# Altium schematic sheet Charging Section.SchDoc
size A; DocumentNumber: 5; SheetNumber: 5; SheetTotal: 8
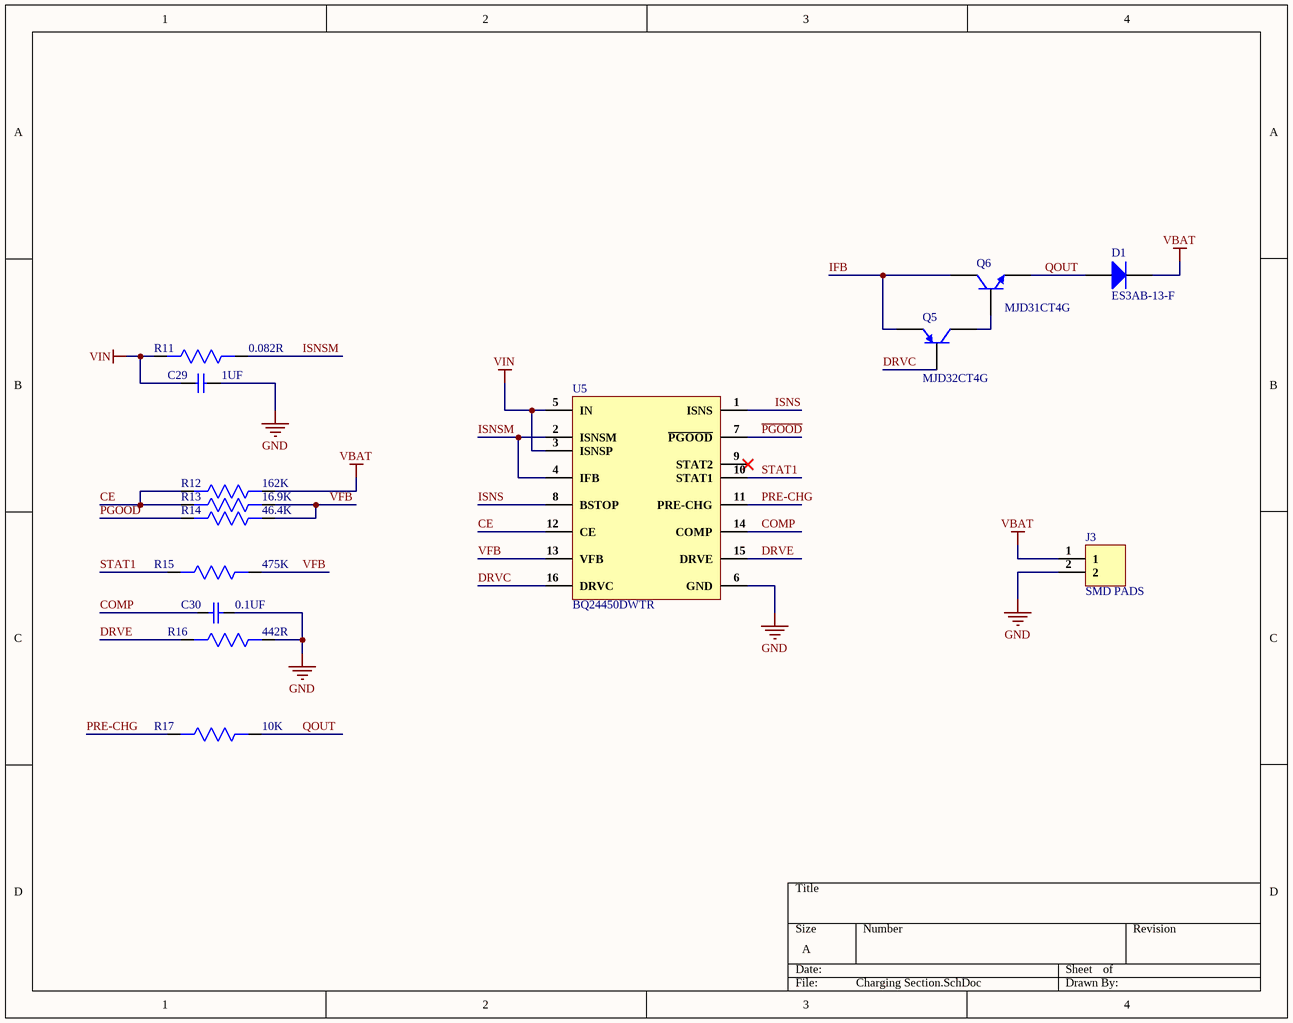
[diagram p0: Charging Section.SchDoc]

## Parts
C29  1UF  [Cap0805]
C30  0.1UF  [CAP 0402]
D1  ES3AB-13-F  [ES3AB-13-F]
J3  SMD PADS  [SMD PAD]
Q5  MJD32CT4G  [DPAK]
Q6  MJD31CT4G  [DPAK]
R11  0.082R  [Res1206]
R12  162K  [Res0603]
R13  16.9K  [Res0402]
R14  46.4K  [Res0402]
R15  475K  [Res0402]
R16  442R  [Res0402]
R17  10K  [Res-0201]
U5  BQ24450DWTR  [16-SOIC]

## Nets
GND: C29.2 C30.1 J3.2 R16.1 U5.6(GND)
VBAT: D1.2(K) J3.1 R12.1
VIN: C29.1 R11.2 U5.3(ISNSP) U5.5(IN)
CE: R12.2 R13.2 U5.12(CE)
COMP: C30.2 U5.14(COMP)
DRVC: Q5.1(B) U5.16(DRVC)
DRVE: R16.2 U5.15(DRVE)
IFB: Q5.3(E) Q6.2_4(C)
ISNS: U5.1(ISNS) U5.8(BSTOP)
ISNSM: R11.1 U5.2(ISNSM) U5.4(IFB)
~{PGOOD}: R14.2 U5.7(~{PGOOD})
PRE-CHG: R17.2 U5.11(PRE-CHG)
QOUT: D1.1(A) Q6.3(E) R17.1
STAT1: R15.2 U5.10(STAT1)
VFB: R13.1 R14.1 R15.1 U5.13(VFB)
NetQ5_2_4: Q5.2_4(C) Q6.1(B)

Not connected (* = marked no-connect by the designer): U5 9(STAT2)*

## Library data of the parts
C29 = CL21B105KBFNNNE: CAP CER 1UF 50V X7R 0805; Manufacturer: Samsung; Tolerance: 10%; Supplier 1: Digi-Key; Manufacturer Part Number: CL21B105KBFNNNE; Stock 1: 550461; Pricing 1: 1=0.13, 10=0.093, 50=0.053, 100=0.0439, 500=0.03076, 1000=0.02547 (USD); Mount: Surface Mount; Case/Package: 0805; Case Code (Metric): 2012; Case Code (Imperial): 0805; Min Operating Temperature: -55°C; Max Operating Temperature: 125°C; Packaging: Tape and Reel; Package Quantity: 1; Capacitance: 1uF; Voltage Rating: 50V; Dielectric: X7R; Voltage: 50V; Length: 2mm; Height: 1.25mm; Width: 0.049inch; Thickness: 0.053inch; Depth: 1.25mm; Radiation Hardening: No; ComponentLink1URL: http://www.samsungsem.com/kr/support/product-search/mlcc/CL21B105KBFNNNE.jsp?src-supplier=Digi-Key; ComponentLink1Description: http://www.samsungsem.com/kr/support/product-search/mlcc/CL21B105KBFNNNE.jsp?src-supplier=Digi-Key; ComponentLink2URL: http://www1.futureelectronics.com/doc/SAMSUNG/CL21B105KBFNNNE.pdf?src-supplier=Future+Electronics; ComponentLink2Description: http://www1.futureelectronics.com/doc/SAMSUNG/CL21B105KBFNNNE.pdf?src-supplier=Future+Electronics; ComponentLink3URL: https://www.verical.com/server-webapp/html/getDatasheet?partID=354075&src-supplier=Verical; ComponentLink3Description: https://www.verical.com/server-webapp/html/getDatasheet?partID=354075&src-supplier=Verical; Supplier Part Number 1: 1276-1029-1-ND
C30 = C0402C104Z4VAC7867: 0.1µF -20%, +80% 16V Ceramic Capacitor Y5V (F) 0402 (1005 Metric); Manufacturer: KEMET; Manufacturer Part Number: C0402C104Z4VACTU; Tolerance: 80%; Capacitance: 100nF; Supplier 1: Digi-Key; Stock 1: 1342942; Pricing 1: 1=0.1, 10=0.018, 100=0.0081, 500=0.00578, 1000=0.00454, 2500=0.00412, 5000=0.0038 (USD); Mount: Surface Mount; Case/Package: 0402; Dielectric Material: Ceramic; Min Operating Temperature: -30°C; Max Operating Temperature: 85°C; Dielectric: Y5V; Packaging: Tape and Reel; Voltage Rating (DC): 16V; Length: 1mm; Height: 0.5mm; Depth: 0.5mm; Radiation Hardening: No; Lead Free: Lead Free; ComponentLink1URL: https://www.verical.com/server-webapp/html/getDatasheet?partID=764272&src-supplier=Verical; ComponentLink1Description: https://www.verical.com/server-webapp/html/getDatasheet?partID=764272&src-supplier=Verical; Supplier Part Number 1: 399-1043-6-ND
D1 = ES3AB-13-F: DIODE GEN PURP 50V 3A SMB; Manufacturer: Diodes; Peak Reverse Current: 10uA; Reverse Recovery Time: 25ns; Peak Non-Repetitive Surge Current: 100A; Element Configuration: Single; Forward Voltage: 900mV; Polarity: Standard; Capacitance: 45pF; Supplier 1: Digi-Key; Manufacturer Part Number: ES3AB-13-F; Stock 1: 36847; Pricing 1: 1=0.62, 10=0.53, 25=0.4948, 100=0.3676, 250=0.34924, 500=0.28704, 1000=0.23331 (USD); Mount: Surface Mount; Case/Package: SMB; Number of Pins: 2; Weight: 0.00328oz; Min Operating Temperature: -55°C; Max Operating Temperature: 150°C; Forward Current: 3A; Max Repetitive Reverse Voltage (Vrrm): 50V; Package Quantity: 3000; Packaging: Tape and Reel; Max Surge Current: 100A; Recovery Time: 25ns; Reverse Voltage (DC): 50V; Average Rectified Current: 3A; Termination: SMD/SMT; Voltage Rating (DC): 50V; Current Rating: 3A; Output Current: 3A; Max Reverse Voltage (DC): 50V; Length: 4.57mm; Height: 2.42mm; Width: 3.94mm; Radiation Hardening: No; Lead Free: Lead Free; ComponentLink1URL: http://www.diodes.com///datasheets/ds14003.pdf?src-supplier=Avnet+Europe; ComponentLink1Description: http://www.diodes.com///datasheets/ds14003.pdf?src-supplier=Avnet+Europe; ComponentLink2URL: http://www.diodes.com///datasheets/ds14003.pdf?src-supplier=Avnet; ComponentLink2Description: http://www.diodes.com///datasheets/ds14003.pdf?src-supplier=Avnet; ComponentLink3URL: https://www.verical.com/server-webapp/html/getDatasheet?partID=61156&src-supplier=Verical; ComponentLink3Description: https://www.verical.com/server-webapp/html/getDatasheet?partID=61156&src-supplier=Verical; ComponentLink4URL: http://www.diodes.com/_files/datasheets/ds14003.pdf?src-supplier=Future+Electronics; ComponentLink4Description: http://www.diodes.com/_files/datasheets/ds14003.pdf?src-supplier=Future+Electronics; Supplier Part Number 1: ES3AB-FDIDKR-ND
J3 = SMD PAD
Q5 = MJD32CT4G: TRANS PNP 100V 3A DPAK
Q6 = MJD31CT4G: TRANS NPN 100V 3A DPAK; Manufacturer: ON Semiconductor; Max Power Dissipation: 1.56W; Transition Frequency: 3MHz; hFE Min: 25; Number of Elements: 1; Emitter Base Voltage (VEBO): 5V; Collector Emitter Saturation Voltage: 1.2V; Element Configuration: Single; Supplier 1: Digi-Key; Manufacturer Part Number: MJD31CT4G; Stock 1: 48908; Pricing 1: 1=0.5, 10=0.427, 25=0.3988, 100=0.2961, 250=0.28132, 500=0.23122, 1000=0.18794 (USD); Case/Package: DPAK; Number of Pins: 3; Contact Plating: Tin,Matte; Min Operating Temperature: -65°C; Max Operating Temperature: 150°C; Collector Emitter Voltage (VCEO): 100V; Packaging: Tape and Reel; Max Collector Current: 3A; Collector Emitter Breakdown Voltage: 100V; Polarity: NPN; Max Breakdown Voltage: 100V; Package Quantity: 1; Frequency: 3MHz; Collector Base Voltage (VCBO): 100V; Power Dissipation: 1.56W; Gain Bandwidth Product: 3MHz; Max Frequency: 3MHz; Voltage Rating (DC): 100V; Current Rating: 3A; Length: 6.73mm; Height: 2.38mm; Width: 6.22mm; Radiation Hardening: No; REACH SVHC: No SVHC; Lead Free: Lead Free; ComponentLink1URL: http://www.onsemi.com/pub/Collateral/MJD31-D.PDF?src-supplier=Digi-Key; ComponentLink1Description: http://www.onsemi.com/pub/Collateral/MJD31-D.PDF?src-supplier=Digi-Key; ComponentLink2URL: http://www.onsemi.com/pub/Collateral/MJD31-D.PDF?src-supplier=Avnet; ComponentLink2Description: http://www.onsemi.com/pub/Collateral/MJD31-D.PDF?src-supplier=Avnet; ComponentLink3URL: http://www.onsemi.com/pub/Collateral/MJD31-D.PDF?src-supplier=Element14; ComponentLink3Description: http://www.onsemi.com/pub/Collateral/MJD31-D.PDF?src-supplier=Element14; ComponentLink4URL: http://www.mouser.com/ds/2/308/MJD31-D-90514.pdf?src-supplier=Mouser; ComponentLink4Description: http://www.mouser.com/ds/2/308/MJD31-D-90514.pdf?src-supplier=Mouser; ComponentLink5URL: http://www.jameco.com/Jameco/Products/ProdDS/1055943.pdf?src-supplier=Jameco; ComponentLink5Description: http://www.jameco.com/Jameco/Products/ProdDS/1055943.pdf?src-supplier=Jameco; ComponentLink6URL: http://www.onsemi.com/pub_link/Collateral/MJD31-D.PDF?src-supplier=Element14; ComponentLink6Description: http://www.onsemi.com/pub_link/Collateral/MJD31-D.PDF?src-supplier=Element14; ComponentLink7URL: http://www.onsemi.com/pub/Collateral/MJD31-D.PDF?src-supplier=Future+Electronics; ComponentLink7Description: http://www.onsemi.com/pub/Collateral/MJD31-D.PDF?src-supplier=Future+Electronics; Supplier Part Number 1: MJD31CT4GOSDKR-ND
R11 = ERJ-8BWJR082V: RES 0.082 OHM 5% 1W 1206; Manufacturer: Panasonic; Resistance: 82mR; Temperature Coefficient: 100ppm/°C; Supplier 1: Digi-Key; Manufacturer Part Number: ERJ-8BWJR082V; Stock 1: 5726; Pricing 1: 1=0.67, 10=0.476, 100=0.2477, 1000=0.13336, 2500=0.12955 (USD); Mount: Surface Mount; Case/Package: 1206; Contact Plating: Tin; Case Code (Metric): 3216; Case Code (Imperial): 1206; Min Operating Temperature: -55°C; Max Operating Temperature: 155°C; Power Rating: 1W; Tolerance: 5%; Composition: Thick Film; Packaging: Tape and Reel; Package Quantity: 1; Number of Terminations: 2; Termination: SMD/SMT; Max Power Dissipation: 1W; Features: Automotive AEC-Q200; Length: 3.2mm; Height: 0.65mm; Width: 0.063inch; Depth: 1.6mm; Radiation Hardening: No; ComponentLink1URL: https://industrial.panasonic.com/cdbs/www-data/pdf/RDN0000/AOA0000C313.pdf?src-supplier=Digi-Key; ComponentLink1Description: https://industrial.panasonic.com/cdbs/www-data/pdf/RDN0000/AOA0000C313.pdf?src-supplier=Digi-Key; ComponentLink2URL: http://industrial.panasonic.com/www-data/pdf/AOA0000/AOA0000CE3.pdf?src-supplier=Avnet+Europe; ComponentLink2Description: http://industrial.panasonic.com/www-data/pdf/AOA0000/AOA0000CE3.pdf?src-supplier=Avnet+Europe; ComponentLink3URL: https://www.alliedelec.com/m/d/343577d27580f3e2a275b8e77c10f6b8.pdf?src-supplier=Allied+Electronics; ComponentLink3Description: https://www.alliedelec.com/m/d/343577d27580f3e2a275b8e77c10f6b8.pdf?src-supplier=Allied+Electronics; ComponentLink4URL: http://www.mouser.com/ds/2/315/AOA0000CE3-72189.pdf?src-supplier=Mouser; ComponentLink4Description: http://www.mouser.com/ds/2/315/AOA0000CE3-72189.pdf?src-supplier=Mouser; ComponentLink5URL: http://uk.rs-online.com/webdocs/13b8/0900766b813b869e.pdf?src-supplier=RSComponents; ComponentLink5Description: http://uk.rs-online.com/webdocs/13b8/0900766b813b869e.pdf?src-supplier=RSComponents; Supplier Part Number 1: P.082AVDKR-ND
R12 = RC0603FR-07162KL: RES SMD 162K OHM 1% 1/10W 0603; Manufacturer: Yageo; Power Rating: 100mW; Resistance: 162kR; Voltage Rating: 75V; Temperature Coefficient: 100ppm/°C; Voltage Rating (DC): 50V; Supplier 1: Digi-Key; Manufacturer Part Number: RC0603FR-07162KL; Stock 1: 119963; Pricing 1: 1=0.1, 10=0.023, 100=0.0094, 1000=0.00421, 2500=0.00366 (USD); Mount: Surface Mount; Case/Package: 0603; Weight: 7.1E-05oz; Case Code (Imperial): 0603; Case Code (Metric): 1608; Min Operating Temperature: -55°C; Max Operating Temperature: 155°C; Tolerance: 1%; Packaging: Tape and Reel; Termination: SMD/SMT; Composition: Thick Film; Military Standard: Not; Length: 1.6mm; Height: 0.45mm; Width: 0.8mm; Depth: 0.8mm; Lead Free: Lead Free; ComponentLink1URL: http://documents.rs-components.com/techlib://itc_doclist_GB.htm?stockno=5049814&src-supplier=RSComponents; ComponentLink1Description: http://documents.rs-components.com/techlib://itc_doclist_GB.htm?stockno=5049814&src-supplier=RSComponents; Supplier Part Number 1: 311-162KHRDKR-ND
R13 = RC0402FR-0716K9L: RES SMD 16.9K OHM 1% 1/16W 0402; Manufacturer: Yageo; Resistance: 16.9kR; Temperature Coefficient: 100ppm/°C; Voltage Rating: 50V; Power Rating: 62.5mW; Max Power Dissipation: 63mW; Supplier 1: Digi-Key; Manufacturer Part Number: RC0402FR-0716K9L; Stock 1: 85975; Pricing 1: 1=0.1, 10=0.016, 100=0.0064, 1000=0.00289, 2500=0.00251, 5000=0.00207 (USD); Case/Package: 0402; Contact Plating: Tin,Matte; Case Code (Imperial): 0402; Case Code (Metric): 1005; Min Operating Temperature: -55°C; Max Operating Temperature: 155°C; Tolerance: 1%; Composition: Thick Film; Package Quantity: 10000; Packaging: Tape and Reel; Number of Terminations: 2; Termination: SMD/SMT; Military Standard: Not; Voltage Rating (DC): 50V; Features: Moisture Resistant; Length: 1mm; Height: 0.016inch; Width: 0.02inch; Depth: 0.5mm; Lead Free: Lead Free; ComponentLink1URL: http://www.yageo.com/documents/recent/PYu-RC0402_51_RoHS_L_6.pdf?src-supplier=Avnet+Europe; ComponentLink1Description: http://www.yageo.com/documents/recent/PYu-RC0402_51_RoHS_L_6.pdf?src-supplier=Avnet+Europe; ComponentLink2URL: http://www.mouser.com/ds/2/447/PYu-RC0402_51_RoHS_L_6_r-8721.pdf?src-supplier=Mouser; ComponentLink2Description: http://www.mouser.com/ds/2/447/PYu-RC0402_51_RoHS_L_6_r-8721.pdf?src-supplier=Mouser; ComponentLink3URL: http://www.yageo.com/documents/recent/PYu-RC0402_51_RoHS_L_6_r.pdf?src-supplier=Future+Electronics; ComponentLink3Description: http://www.yageo.com/documents/recent/PYu-RC0402_51_RoHS_L_6_r.pdf?src-supplier=Future+Electronics; Supplier Part Number 1: YAG3003DKR-ND
R14 = ERJ-2RKF4642X: RES SMD 46.4K OHM 1% 1/10W 0402; Manufacturer: Panasonic; Resistance: 46.4kR; Temperature Coefficient: 100ppm/°C; Power Rating: 100mW; Voltage Rating: 50V; Supplier 1: Digi-Key; Manufacturer Part Number: ERJ-2RKF4642X; Stock 1: 59686; Pricing 1: 1=0.1, 10=0.024, 100=0.0097, 1000=0.00437, 2500=0.0038, 5000=0.00314 (USD); Mount: Surface Mount; Case/Package: 0402; Contact Plating: Tin; Case Code (Metric): 1005; Case Code (Imperial): 0402; Min Operating Temperature: -55°C; Max Operating Temperature: 155°C; Tolerance: 1%; Composition: Thick Film; Packaging: Tape and Reel; Package Quantity: 1; Number of Terminations: 2; Termination: SMD/SMT; Military Standard: Not; Max Power Dissipation: 100mW; Voltage Rating (DC): 50V; Features: Automotive AEC-Q200; Length: 1mm; Height: 0.35mm; Width: 0.02inch; Depth: 0.5mm; Radiation Hardening: No; REACH SVHC: Yes; Lead Free: Lead Free; ComponentLink1URL: http://www.industrial.panasonic.com/www-data/pdf/AOA0000/AOA0000CE2.pdf?src-supplier=Element14; ComponentLink1Description: http://www.industrial.panasonic.com/www-data/pdf/AOA0000/AOA0000CE2.pdf?src-supplier=Element14; ComponentLink2URL: http://industrial.panasonic.com/www-data/pdf/AOA0000/AOA0000CE2.pdf?src-supplier=Avnet; ComponentLink2Description: http://industrial.panasonic.com/www-data/pdf/AOA0000/AOA0000CE2.pdf?src-supplier=Avnet; ComponentLink3URL: http://www.farnell.com/datasheets/1678782.pdf?src-supplier=Farnell; ComponentLink3Description: http://www.farnell.com/datasheets/1678782.pdf?src-supplier=Farnell; ComponentLink4URL: http://www.farnell.com/datasheets/1678782.pdf?src-supplier=Element14; ComponentLink4Description: http://www.farnell.com/datasheets/1678782.pdf?src-supplier=Element14; ComponentLink5URL: http://www.farnell.com/datasheets/1911175.pdf?src-supplier=Farnell; ComponentLink5Description: http://www.farnell.com/datasheets/1911175.pdf?src-supplier=Farnell; ComponentLink6URL: https://www.alliedelec.com/m/d/623f45ff1957d936ff56d46fd1c28cac.pdf?src-supplier=Allied+Electronics; ComponentLink6Description: https://www.alliedelec.com/m/d/623f45ff1957d936ff56d46fd1c28cac.pdf?src-supplier=Allied+Electronics; Supplier Part Number 1: P46.4KLDKR-ND
R15 = ERJ-2RKF4753X: RES SMD 475K OHM 1% 1/10W 0402; Manufacturer: Panasonic; Resistance: 475kR; Power Rating: 100mW; Voltage Rating: 50V; Temperature Coefficient: 100ppm/°C; Supplier 1: Digi-Key; Manufacturer Part Number: ERJ-2RKF4753X; Stock 1: 83446; Pricing 1: 1=0.1, 10=0.041, 100=0.0166, 1000=0.00747, 2500=0.00649, 5000=0.00536 (USD); Mount: Surface Mount; Case/Package: 0402; Case Code (Metric): 1005; Case Code (Imperial): 0402; Contact Plating: Tin; Min Operating Temperature: -55°C; Max Operating Temperature: 155°C; Tolerance: 1%; Packaging: Tape and Reel; Package Quantity: 10000; Composition: Thick Film; Number of Terminations: 2; Termination: SMD/SMT; Military Standard: Not; Max Power Dissipation: 100mW; Voltage Rating (DC): 50V; Length: 1mm; Height: 0.35mm; Width: 0.02inch; Depth: 0.5mm; REACH SVHC: Yes; Lead Free: Lead Free; ComponentLink1URL: http://www.industrial.panasonic.com/www-data/pdf/AOA0000/AOA0000CE2.pdf?src-supplier=Element14; ComponentLink1Description: http://www.industrial.panasonic.com/www-data/pdf/AOA0000/AOA0000CE2.pdf?src-supplier=Element14; ComponentLink2URL: http://www.farnell.com/datasheets/1678782.pdf?src-supplier=Element14; ComponentLink2Description: http://www.farnell.com/datasheets/1678782.pdf?src-supplier=Element14; ComponentLink3URL: http://industrial.panasonic.com/www-data/pdf/AOA0000/AOA0000CE2.pdf?src-supplier=Avnet; ComponentLink3Description: http://industrial.panasonic.com/www-data/pdf/AOA0000/AOA0000CE2.pdf?src-supplier=Avnet; ComponentLink4URL: http://www.farnell.com/datasheets/1678782.pdf?src-supplier=Farnell; ComponentLink4Description: http://www.farnell.com/datasheets/1678782.pdf?src-supplier=Farnell; ComponentLink5URL: http://industrial.panasonic.com/cdbs/www-data/pdf/RDA0000/AOA0000C304.pdf?src-supplier=Farnell; ComponentLink5Description: http://industrial.panasonic.com/cdbs/www-data/pdf/RDA0000/AOA0000C304.pdf?src-supplier=Farnell; ComponentLink6URL: http://www.alliedelec.com/m/d/623f45ff1957d936ff56d46fd1c28cac.pdf?src-supplier=Allied+Electronics; ComponentLink6Description: http://www.alliedelec.com/m/d/623f45ff1957d936ff56d46fd1c28cac.pdf?src-supplier=Allied+Electronics; Supplier Part Number 1: P475KLCT-ND
R16 = RC0402FR-07442RL: RES SMD 442 OHM 1% 1/16W 0402; Manufacturer: Yageo; Temperature Coefficient: 100ppm/°C; Power Rating: 62.5mW; Voltage Rating: 50V; Max Power Dissipation: 63mW; Supplier 1: Digi-Key; Manufacturer Part Number: RC0402FR-07442RL; Stock 1: 549714; Pricing 1: 1=0.1, 10=0.016, 100=0.0064, 1000=0.00289, 2500=0.00251, 5000=0.00207 (USD); Case/Package: 0402; Contact Plating: Tin,Matte; Case Code (Imperial): 0402; Case Code (Metric): 1005; Min Operating Temperature: -55°C; Max Operating Temperature: 155°C; Resistance: 442R; Tolerance: 1%; Composition: Thick Film; Packaging: Tape and Reel; Termination: SMD/SMT; Number of Terminations: 2; Military Standard: Not; Voltage Rating (DC): 50V; Features: Moisture Resistant; Length: 1mm; Height: 0.016inch; Width: 0.5mm; Depth: 0.5mm; Lead Free: Lead Free; ComponentLink1URL: http://www.yageo.com/documents/recent/PYu-RC0402_51_RoHS_L_6_r.pdf?src-supplier=Future+Electronics; ComponentLink1Description: http://www.yageo.com/documents/recent/PYu-RC0402_51_RoHS_L_6_r.pdf?src-supplier=Future+Electronics; ComponentLink2URL: http://www.yageo.com/documents/recent/PYu-RC0402_51_RoHS_L_6.pdf?src-supplier=Avnet; ComponentLink2Description: http://www.yageo.com/documents/recent/PYu-RC0402_51_RoHS_L_6.pdf?src-supplier=Avnet; ComponentLink3URL: http://www.yageo.com/documents/recent/PYu-RC0402_51_RoHS_L_6.pdf?src-supplier=Avnet+Europe; ComponentLink3Description: http://www.yageo.com/documents/recent/PYu-RC0402_51_RoHS_L_6.pdf?src-supplier=Avnet+Europe; Supplier Part Number 1: YAG3162DKR-ND
R17 = RC0201JR-0710KL: RES SMD 10K OHM 5% 1/20W 0201; Manufacturer: Yageo; Resistance: 10kR; Temperature Coefficient: 200ppm/°C; Power Rating: 50mW; Voltage Rating: 25V; Supplier 1: Digi-Key; Manufacturer Part Number: RC0201JR-0710KL; Stock 1: 1378070; Pricing 1: 1=0.1, 10=0.028, 100=0.0115, 1000=0.00517, 2500=0.00448, 5000=0.00371 (USD); Case/Package: 0201; Contact Plating: Tin,Matte; Case Code (Imperial): 0201; Case Code (Metric): 0603; Min Operating Temperature: -55°C; Max Operating Temperature: 125°C; Tolerance: 5%; Composition: Thick Film; Packaging: Tape and Reel; Termination: SMD/SMT; Military Standard: Not; Voltage Rating (DC): 25V; Length: 0.6mm; Depth: 0.3mm; Radiation Hardening: No; REACH SVHC: Unknown; Lead Free: Lead Free; ComponentLink1URL: http://www.farnell.com/datasheets/2167052.pdf?src-supplier=Element14; ComponentLink1Description: http://www.farnell.com/datasheets/2167052.pdf?src-supplier=Element14; ComponentLink2URL: http://www.yageo.com/documents/recent/PYu-RC0201_51_RoHS_L_8.pdf?src-supplier=Avnet+Europe; ComponentLink2Description: http://www.yageo.com/documents/recent/PYu-RC0201_51_RoHS_L_8.pdf?src-supplier=Avnet+Europe; ComponentLink3URL: http://www.yageo.com/documents/recent/PYu-RC0201_51_RoHS_L_8.pdf?src-supplier=Avnet; ComponentLink3Description: http://www.yageo.com/documents/recent/PYu-RC0201_51_RoHS_L_8.pdf?src-supplier=Avnet; Supplier Part Number 1: 311-10KNDKR-ND
U5 = BQ24450DWTR: IC BATTERY CHARGER CTRLR 16-SOIC; Manufacturer: Texas Instruments; Min Supply Voltage: 5V; Max Supply Voltage: 40V; Output Current: 2A; Supplier 1: Digi-Key; Manufacturer Part Number: BQ24450DWTR; Stock 1: 1069; Pricing 1: 1=11.3, 10=10.206, 25=9.7312, 100=8.0699, 250=7.35784, 500=6.88316, 1000=6.31351 (USD); Case/Package: SOIC; Number of Pins: 16; Weight: 0.016709oz; Contact Plating: Gold; Min Operating Temperature: -40°C; Max Operating Temperature: 70°C; Packaging: Tape and Reel; Package Quantity: 1; Min Input Voltage: 5V; Max Charge Current: 2A; Radiation Hardening: No; Lead Free: Lead Free; REACH SVHC: No SVHC; ComponentLink1URL: http://www.farnell.com/datasheets/1705294.pdf?src-supplier=Element14; ComponentLink1Description: http://www.farnell.com/datasheets/1705294.pdf?src-supplier=Element14; ComponentLink2URL: http://www.ti.com/lit/ds/symlink/bq24450.pdf?src-supplier=Digi-Key; ComponentLink2Description: http://www.ti.com/lit/ds/symlink/bq24450.pdf?src-supplier=Digi-Key; ComponentLink3URL: https://www.verical.com/server-webapp/html/getDatasheet?partID=516702&src-supplier=Verical; ComponentLink3Description: https://www.verical.com/server-webapp/html/getDatasheet?partID=516702&src-supplier=Verical; ComponentLink4URL: http://www.ti.com/lit/gpn/bq24450?src-supplier=Mouser; ComponentLink4Description: http://www.ti.com/lit/gpn/bq24450?src-supplier=Mouser; ComponentLink5URL: http://www.ti.com/lit/ds/symlink/bq24450.pdf?src-supplier=Avnet+Europe; ComponentLink5Description: http://www.ti.com/lit/ds/symlink/bq24450.pdf?src-supplier=Avnet+Europe; ComponentLink6URL: http://www.ti.com/general/docs/lit/getliterature.tsp?genericPartNumber=BQ24450&&fileType=pdf&src-supplier=Avnet; ComponentLink6Description: http://www.ti.com/general/docs/lit/getliterature.tsp?genericPartNumber=BQ24450&&fileType=pdf&src-supplier=Avnet; Supplier Part Number 1: 296-24367-6-ND